# Altium schematic sheet JTAG_Clock.SchDoc
size A4; SheetNumber: 4; SheetTotal: 5
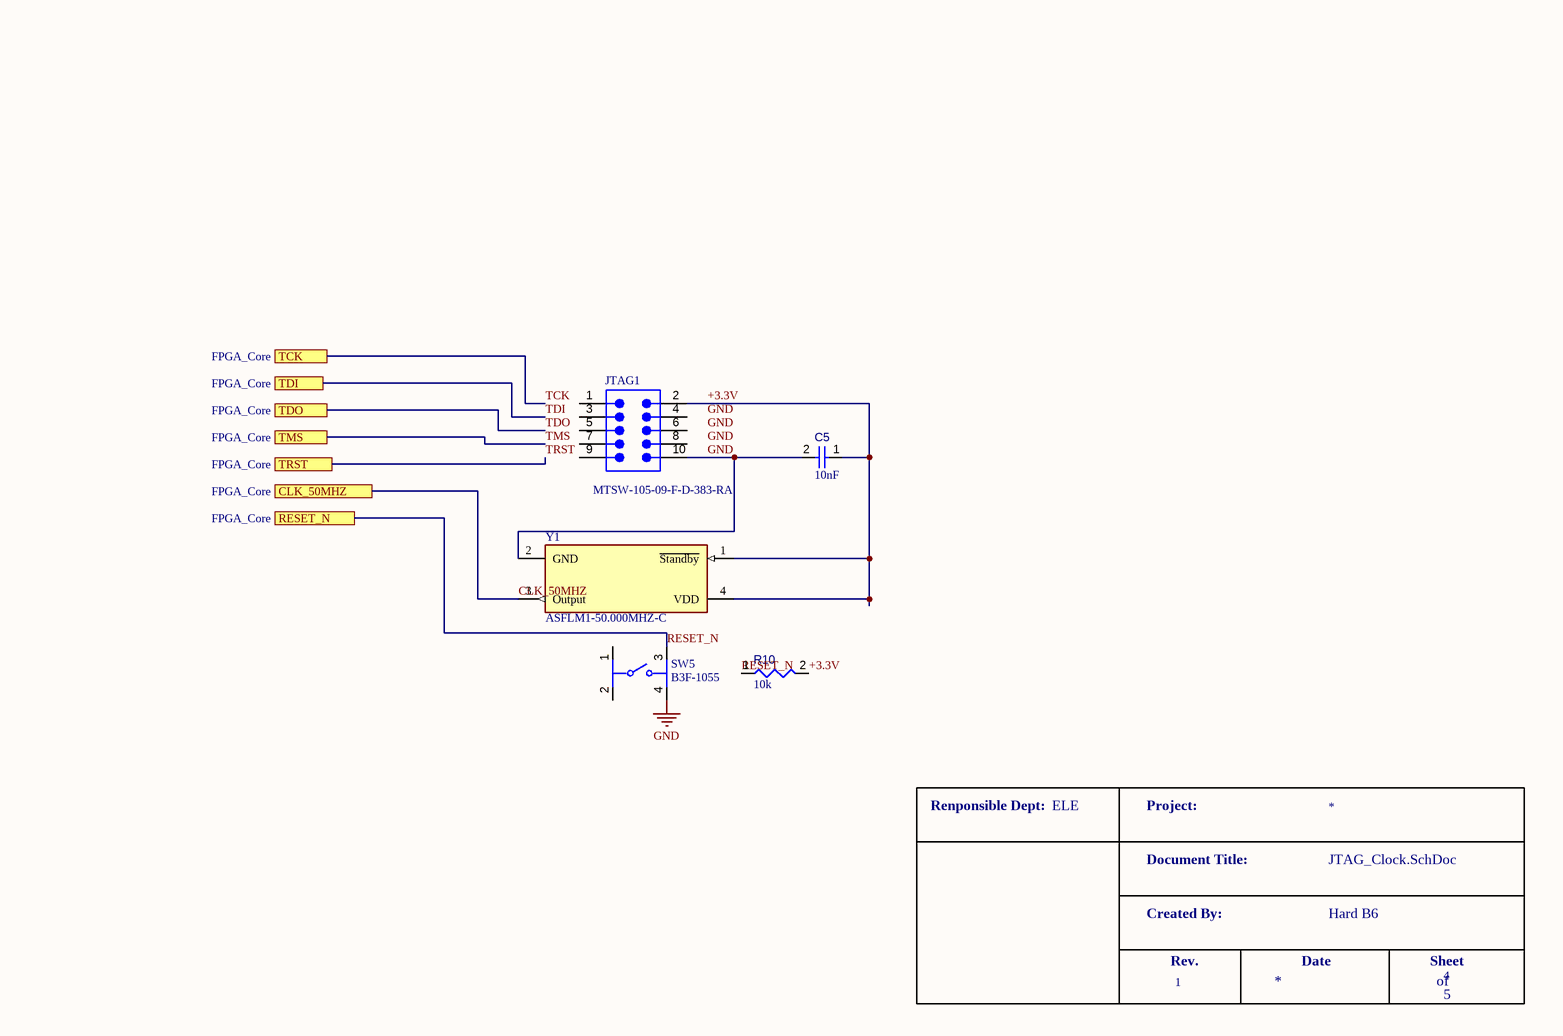
[diagram p0: JTAG_Clock.SchDoc]

## Parts
*  HSHL Title Block  (value not drawn)  (graphical)
C5  value 10nF  [CAPC0402(1005)60_L]  (hidden comment: Capacitor 10nF +/-20% 50V 0402)
JTAG1  MTSW-105-09-F-D-383-RA  [SMTC-MTSW-105-09-X-D-383-RA]
R10  value 10k  [RESC0402(1005)_L]  (hidden comment: 10KR2F)
SW5  B3F-1055  [FP-B3F-1055-MFG]
Y1  ASFLM1-50.000MHZ-C  [FP-ASFLM-MFG]

## Ports
CLK_50MHZ (see FPGA_Core), RESET_N (see FPGA_Core), TCK (see FPGA_Core), TDI (see FPGA_Core), TDO (see FPGA_Core), TMS (see FPGA_Core), TRST (see FPGA_Core)

## Nets
GND: C5.2 JTAG1.10 SW5.4 Y1.2(GND)
+3.3V: C5.1 JTAG1.2 R10.2 Y1.1(~{Standby}) Y1.4(VDD)
CLK_50MHZ: Y1.3(Output) ; port CLK_50MHZ
RESET_N: R10.1 SW5.3 ; port RESET_N
TCK: port TCK
TDI: port TDI
TDO: port TDO
TMS: port TMS
TRST: port TRST

Not connected (* = marked no-connect by the designer): JTAG1 1 3 4 5 6 7 8 9; SW5 1 2

## Notes on the sheet
- Labels drawn without touching a wire or pin: GND
- DWG. NO.
- REV.
- SHT.
- THIS DOCUMENT AND THE DATA DISCLOSED HEREIN OR HEREWITH IS THE PROPERTY OF ALTIUM LIMITED AND MAY BE FREELY DISTRIBUTED IN WHOLE. NO RIGHTS ARE RESERVED OR EXPRESS OR IMPLIED WARANTEE GIVEN.
- REVISION
- DESCRIPTION
- DATE
- APPROVED
- ENG:
- APPROVALS
- PROJECT
- DSN:
- CHK:
- REFERENCE DOCUMENTS
- PROJECT REVISION:
- TITLE
- DOCUMENT REVISION:
- DESIGN ITEM:
- BOM:
- FAB DWG:
- PCB DWG:
- ASSY DWG:
- SCALE:
- SIZE
- B
- CAGE CODE
- FILE NAME
- DWG NO.
- SHEET
- OF
- REV
- (in symbol HSHL Title Block) Renponsible Dept:; ELE; Project:; Document Title:; Created By:; Hard B6; Rev.; Date; Sheet; 1; of

## Library data of the parts
C5 = CMP-001-00069-3: Chip Capacitor, 10nF +/-20%, 50V, 0402, Thickness 0.6 mm; Tolerance: 5%; Max Operating Temperature: 85°C; Pins: 2; Case/Package: 0402; Voltage Rating: 50V; Min Operating Temperature: -55°C; Mounting Technology: SMT
JTAG1 = CMP-002-00071-1: Pin Header, Board-to-Board, 2 Rows, 10 Contacts, Through Hole, MTSW Series, Unshrouded, Horizontal; Min Operating Temperature: -55°C; Pins: 10; Max Operating Temperature: 125°C
R10 = CMP-009-00066-2: 10K 0.063W 1% 0402 (1005 Metric)  SMD; Power: 63mW; Case/Package: 0402; Mounting Technology: SMT; Pins: 2; Tolerance: 1%
SW5 = CMP-08834-000061-1: SWITCH TACTILE SPST-NO 0.05A 24V; Switch Travel: 0.25mm; Mechanical Life: 100000Cycles; Max Current Rating: 50mA; Actuator Color: Orange; Throw Configuration: SPST; Switch Function: Off-Mom; Contact Resistance: 100mR; Number of Poles: 1; Operating Force: 2.55N; Illumination Type: Non-Illuminated; Electrical Life: 300000Cycles; Actuator Length: 3mm; Termination: PC Pins; Contact Plating: Silver; Depth: 6mm; Max Voltage Rating (DC): 24V; Voltage Rating (DC): 24V; Package Quantity: 1500; Lead Free: Lead Free; Min Operating Temperature: -25°C; Max Operating Temperature: 70°C; Mount: Through Hole; Series: B3F; Contact Current Rating: 50mA; Orientation: Straight; Width: 6mm; RoHS Compliant: Yes; Contact Type: 1 maker; Weight: 0.25g; Packaging: Bag; Contact Material: Gold; Length: 6mm; Height: 7.3mm; Current Rating: 50mA
Y1 = CMP-27762-000850-1: MEMS Oscillator 50MHz ±50ppm LVCMOS 3.0V 4-SMD 5mm x 3.2mm; Load Capacitance: 15pF; Packaging: Rail/Tube; RoHS Compliant: Yes; Frequency Stability: 50ppm; Radiation Hardening: No; Frequency: 50MHz; Case/Package: QFN